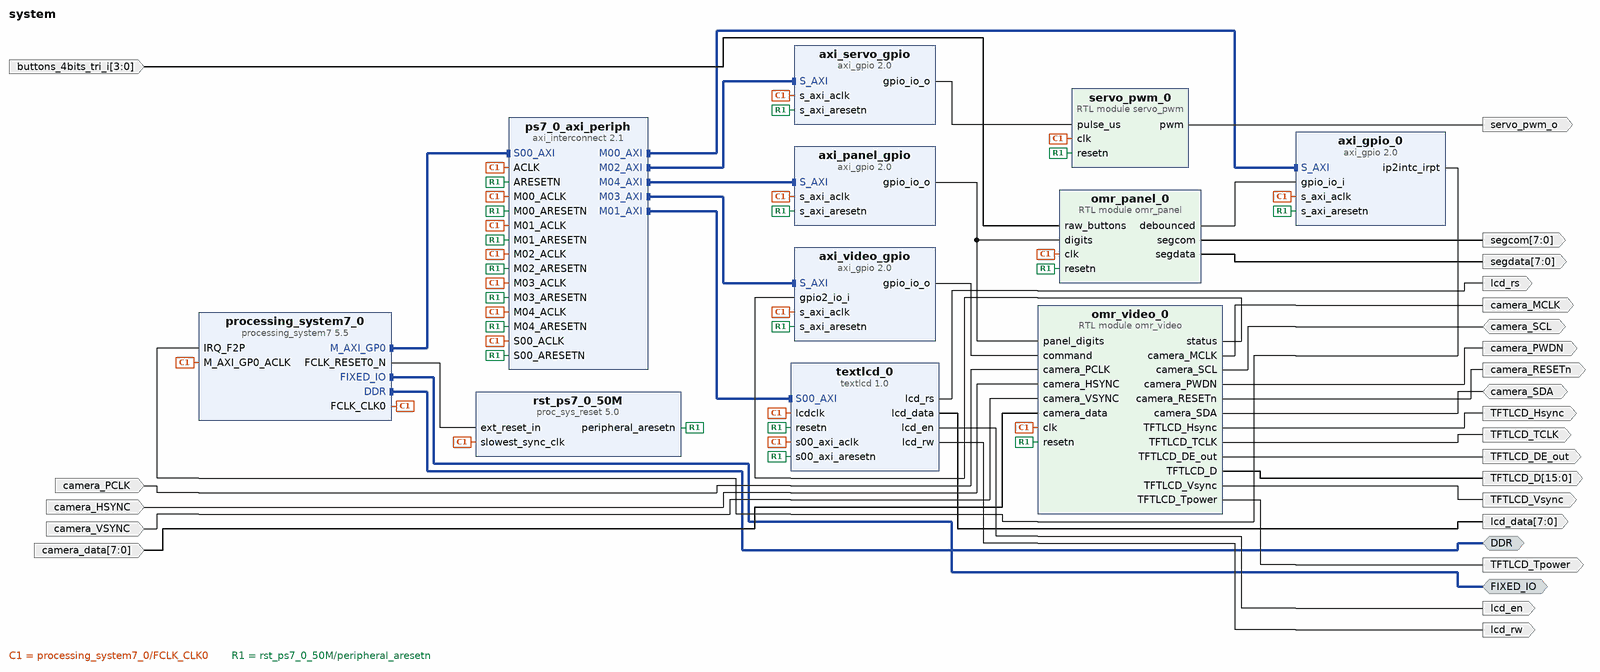
[diagram p0: block diagram of the top level]
# Vivado block design system, xc7z020clg484-1, Vivado 2019.1
create_bd_design system

create_bd_intf_port -mode Master -vlnv xilinx.com:interface:ddrx_rtl:1.0 DDR
create_bd_intf_port -mode Master -vlnv xilinx.com:display_processing_system7:fixedio_rtl:1.0 FIXED_IO
create_bd_port -dir O lcd_rs
create_bd_port -dir O lcd_rw
create_bd_port -dir O lcd_en
create_bd_port -dir O -from 7 -to 0 lcd_data
create_bd_port -dir O servo_pwm_o
create_bd_port -dir I -from 3 -to 0 buttons_4bits_tri_i
create_bd_port -dir I camera_PCLK
create_bd_port -dir I camera_HSYNC
create_bd_port -dir I camera_VSYNC
create_bd_port -dir IO camera_SCL
create_bd_port -dir IO camera_SDA
create_bd_port -dir O camera_MCLK
create_bd_port -dir O camera_RESETn
create_bd_port -dir O camera_PWDN
create_bd_port -dir O TFTLCD_TCLK
create_bd_port -dir O TFTLCD_Hsync
create_bd_port -dir O TFTLCD_Vsync
create_bd_port -dir O TFTLCD_DE_out
create_bd_port -dir O TFTLCD_Tpower
create_bd_port -dir I -from 7 -to 0 camera_data
create_bd_port -dir O -from 15 -to 0 TFTLCD_D
create_bd_port -dir O -from 7 -to 0 segcom
create_bd_port -dir O -from 7 -to 0 segdata

create_bd_cell -type ip -vlnv xilinx.com:ip:processing_system7:5.5 processing_system7_0
set_property -dict [list \
  CONFIG.PCW_I2C0_GRP_INT_ENABLE 0 \
  CONFIG.PCW_I2C0_I2C0_IO {MIO 50 .. 51} \
  CONFIG.PCW_I2C0_PERIPHERAL_ENABLE 1 \
  CONFIG.PCW_I2C_PERIPHERAL_FREQMHZ 111.111115 \
  CONFIG.PCW_IRQ_F2P_INTR 1 \
  CONFIG.PCW_PRESET_BANK1_VOLTAGE {LVCMOS 1.8V} \
  CONFIG.PCW_SD0_GRP_CD_ENABLE 0 \
  CONFIG.PCW_SD0_GRP_WP_ENABLE 0 \
  CONFIG.PCW_SD0_PERIPHERAL_ENABLE 1 \
  CONFIG.PCW_SD0_SD0_IO {MIO 40 .. 45} \
  CONFIG.PCW_SDIO_PERIPHERAL_FREQMHZ 100 \
  CONFIG.PCW_UART1_PERIPHERAL_ENABLE 1 \
  CONFIG.PCW_UART1_UART1_IO {MIO 48 .. 49} \
  CONFIG.PCW_UART_PERIPHERAL_FREQMHZ 100 \
  CONFIG.PCW_UIPARAM_DDR_PARTNO {MT41J256M16 RE-125} \
  CONFIG.PCW_USE_FABRIC_INTERRUPT 1 \
] [get_bd_cells processing_system7_0]
# 78 more settings of processing_system7_0 are not shown: defaults, MIO pin electricals, DDR timing, and values the tool derives
create_bd_cell -type ip -vlnv xilinx.com:ip:axi_gpio:2.0 axi_gpio_0
set_property -dict {CONFIG.C_ALL_INPUTS 1 CONFIG.C_GPIO_WIDTH 4 CONFIG.C_INTERRUPT_PRESENT 1} [get_bd_cells axi_gpio_0]
create_bd_cell -type ip -vlnv xilinx.com:ip:axi_interconnect:2.1 ps7_0_axi_periph
set_property -dict {CONFIG.NUM_MI 5} [get_bd_cells ps7_0_axi_periph]
create_bd_cell -type ip -vlnv xilinx.com:ip:proc_sys_reset:5.0 rst_ps7_0_50M
create_bd_cell -type ip -vlnv xilinx.com:user:textlcd:1.0 textlcd_0
create_bd_cell -type ip -vlnv xilinx.com:ip:axi_gpio:2.0 axi_servo_gpio
set_property -dict {CONFIG.C_ALL_OUTPUTS 1 CONFIG.C_DOUT_DEFAULT 0x00000000 CONFIG.C_GPIO_WIDTH 12} [get_bd_cells axi_servo_gpio]
create_bd_cell -type module -reference servo_pwm servo_pwm_0
create_bd_cell -type module -reference omr_panel omr_panel_0
create_bd_cell -type ip -vlnv xilinx.com:ip:axi_gpio:2.0 axi_video_gpio
set_property -dict [list \
  CONFIG.C_ALL_INPUTS_2 1 \
  CONFIG.C_ALL_OUTPUTS 1 \
  CONFIG.C_GPIO2_WIDTH 32 \
  CONFIG.C_GPIO_WIDTH 32 \
  CONFIG.C_IS_DUAL 1 \
] [get_bd_cells axi_video_gpio]
create_bd_cell -type ip -vlnv xilinx.com:ip:axi_gpio:2.0 axi_panel_gpio
set_property -dict {CONFIG.C_ALL_OUTPUTS 1 CONFIG.C_GPIO_WIDTH 32} [get_bd_cells axi_panel_gpio]
create_bd_cell -type module -reference omr_video omr_video_0

# ---- connections ----

connect_bd_intf_net [get_bd_intf_ports FIXED_IO] [get_bd_intf_pins processing_system7_0/FIXED_IO]
connect_bd_intf_net [get_bd_intf_pins ps7_0_axi_periph/M00_AXI] [get_bd_intf_pins axi_gpio_0/S_AXI]
connect_bd_intf_net [get_bd_intf_ports DDR] [get_bd_intf_pins processing_system7_0/DDR]
connect_bd_intf_net [get_bd_intf_pins ps7_0_axi_periph/M04_AXI] [get_bd_intf_pins axi_panel_gpio/S_AXI]
connect_bd_intf_net [get_bd_intf_pins ps7_0_axi_periph/M03_AXI] [get_bd_intf_pins axi_video_gpio/S_AXI]
connect_bd_intf_net [get_bd_intf_pins ps7_0_axi_periph/M02_AXI] [get_bd_intf_pins axi_servo_gpio/S_AXI]
connect_bd_intf_net [get_bd_intf_pins processing_system7_0/M_AXI_GP0] [get_bd_intf_pins ps7_0_axi_periph/S00_AXI]
connect_bd_intf_net [get_bd_intf_pins ps7_0_axi_periph/M01_AXI] [get_bd_intf_pins textlcd_0/S00_AXI]
connect_bd_net [get_bd_pins processing_system7_0/FCLK_CLK0] \
  [get_bd_pins processing_system7_0/M_AXI_GP0_ACLK] [get_bd_pins ps7_0_axi_periph/S00_ACLK] \
  [get_bd_pins rst_ps7_0_50M/slowest_sync_clk] [get_bd_pins axi_gpio_0/s_axi_aclk] [get_bd_pins ps7_0_axi_periph/M00_ACLK] \
  [get_bd_pins ps7_0_axi_periph/ACLK] [get_bd_pins textlcd_0/s00_axi_aclk] [get_bd_pins ps7_0_axi_periph/M01_ACLK] \
  [get_bd_pins textlcd_0/lcdclk] [get_bd_pins ps7_0_axi_periph/M02_ACLK] [get_bd_pins axi_servo_gpio/s_axi_aclk] \
  [get_bd_pins servo_pwm_0/clk] [get_bd_pins ps7_0_axi_periph/M03_ACLK] [get_bd_pins axi_video_gpio/s_axi_aclk] \
  [get_bd_pins ps7_0_axi_periph/M04_ACLK] [get_bd_pins axi_panel_gpio/s_axi_aclk] [get_bd_pins omr_panel_0/clk] \
  [get_bd_pins omr_video_0/clk]
connect_bd_net [get_bd_pins processing_system7_0/FCLK_RESET0_N] [get_bd_pins rst_ps7_0_50M/ext_reset_in]
connect_bd_net [get_bd_pins rst_ps7_0_50M/peripheral_aresetn] \
  [get_bd_pins ps7_0_axi_periph/S00_ARESETN] [get_bd_pins axi_gpio_0/s_axi_aresetn] \
  [get_bd_pins ps7_0_axi_periph/M00_ARESETN] [get_bd_pins ps7_0_axi_periph/ARESETN] [get_bd_pins textlcd_0/s00_axi_aresetn] \
  [get_bd_pins ps7_0_axi_periph/M01_ARESETN] [get_bd_pins textlcd_0/resetn] [get_bd_pins ps7_0_axi_periph/M02_ARESETN] \
  [get_bd_pins axi_servo_gpio/s_axi_aresetn] [get_bd_pins servo_pwm_0/resetn] [get_bd_pins ps7_0_axi_periph/M03_ARESETN] \
  [get_bd_pins axi_video_gpio/s_axi_aresetn] [get_bd_pins ps7_0_axi_periph/M04_ARESETN] \
  [get_bd_pins axi_panel_gpio/s_axi_aresetn] [get_bd_pins omr_panel_0/resetn] [get_bd_pins omr_video_0/resetn]
connect_bd_net [get_bd_pins textlcd_0/lcd_rs] [get_bd_ports lcd_rs]
connect_bd_net [get_bd_pins textlcd_0/lcd_rw] [get_bd_ports lcd_rw]
connect_bd_net [get_bd_pins textlcd_0/lcd_en] [get_bd_ports lcd_en]
connect_bd_net [get_bd_pins textlcd_0/lcd_data] [get_bd_ports lcd_data]
connect_bd_net [get_bd_pins axi_servo_gpio/gpio_io_o] [get_bd_pins servo_pwm_0/pulse_us]
connect_bd_net [get_bd_pins servo_pwm_0/pwm] [get_bd_ports servo_pwm_o]
connect_bd_net [get_bd_pins axi_video_gpio/gpio_io_o] [get_bd_pins omr_video_0/command]
connect_bd_net [get_bd_pins omr_video_0/status] [get_bd_pins axi_video_gpio/gpio2_io_i]
connect_bd_net [get_bd_pins axi_panel_gpio/gpio_io_o] [get_bd_pins omr_panel_0/digits] [get_bd_pins omr_video_0/panel_digits]
connect_bd_net [get_bd_ports buttons_4bits_tri_i] [get_bd_pins omr_panel_0/raw_buttons]
connect_bd_net [get_bd_pins omr_panel_0/debounced] [get_bd_pins axi_gpio_0/gpio_io_i]
connect_bd_net [get_bd_pins axi_gpio_0/ip2intc_irpt] [get_bd_pins processing_system7_0/IRQ_F2P]
connect_bd_net [get_bd_ports camera_PCLK] [get_bd_pins omr_video_0/camera_PCLK]
connect_bd_net [get_bd_ports camera_HSYNC] [get_bd_pins omr_video_0/camera_HSYNC]
connect_bd_net [get_bd_ports camera_VSYNC] [get_bd_pins omr_video_0/camera_VSYNC]
connect_bd_net [get_bd_ports camera_SCL] [get_bd_pins omr_video_0/camera_SCL]
connect_bd_net [get_bd_ports camera_SDA] [get_bd_pins omr_video_0/camera_SDA]
connect_bd_net [get_bd_pins omr_video_0/camera_MCLK] [get_bd_ports camera_MCLK]
connect_bd_net [get_bd_pins omr_video_0/camera_RESETn] [get_bd_ports camera_RESETn]
connect_bd_net [get_bd_pins omr_video_0/camera_PWDN] [get_bd_ports camera_PWDN]
connect_bd_net [get_bd_pins omr_video_0/TFTLCD_TCLK] [get_bd_ports TFTLCD_TCLK]
connect_bd_net [get_bd_pins omr_video_0/TFTLCD_Hsync] [get_bd_ports TFTLCD_Hsync]
connect_bd_net [get_bd_pins omr_video_0/TFTLCD_Vsync] [get_bd_ports TFTLCD_Vsync]
connect_bd_net [get_bd_pins omr_video_0/TFTLCD_DE_out] [get_bd_ports TFTLCD_DE_out]
connect_bd_net [get_bd_pins omr_video_0/TFTLCD_Tpower] [get_bd_ports TFTLCD_Tpower]
connect_bd_net [get_bd_ports camera_data] [get_bd_pins omr_video_0/camera_data]
connect_bd_net [get_bd_pins omr_video_0/TFTLCD_D] [get_bd_ports TFTLCD_D]
connect_bd_net [get_bd_pins omr_panel_0/segcom] [get_bd_ports segcom]
connect_bd_net [get_bd_pins omr_panel_0/segdata] [get_bd_ports segdata]

# ---- address map ----
assign_bd_address -offset 0x41200000 -range 64K -target_address_space [get_bd_addr_spaces processing_system7_0/Data] [get_bd_addr_segs axi_gpio_0/S_AXI/Reg]
assign_bd_address -offset 0x41210000 -range 64K -target_address_space [get_bd_addr_spaces processing_system7_0/Data] [get_bd_addr_segs axi_servo_gpio/S_AXI/Reg]
assign_bd_address -offset 0x41220000 -range 64K -target_address_space [get_bd_addr_spaces processing_system7_0/Data] [get_bd_addr_segs axi_video_gpio/S_AXI/Reg]
assign_bd_address -offset 0x41230000 -range 64K -target_address_space [get_bd_addr_spaces processing_system7_0/Data] [get_bd_addr_segs axi_panel_gpio/S_AXI/Reg]
assign_bd_address -offset 0x43C00000 -range 64K -target_address_space [get_bd_addr_spaces processing_system7_0/Data] [get_bd_addr_segs textlcd_0/S00_AXI/S00_AXI_reg]

validate_bd_design
save_bd_design
